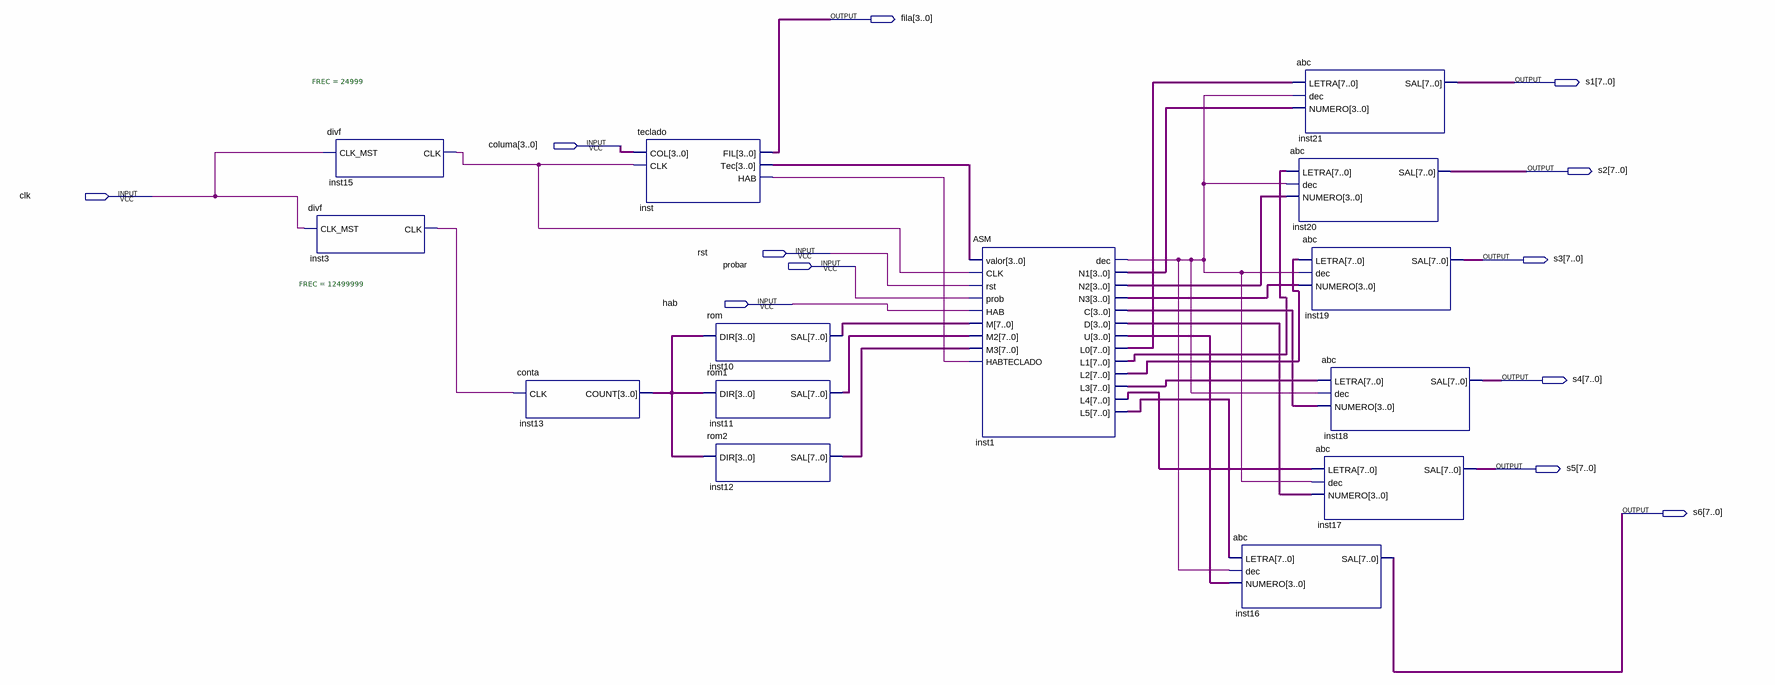
[diagram p0: schematic sheet]
// Quartus schematic numA.bdf as structural Verilog: 14 symbols, 12 pins
module numA (
  input  [3:0] columa,
  input  clk,
  input  rst,
  input  probar,
  input  hab,
  output [3:0] fila,
  output [7:0] s1,
  output [7:0] s2,
  output [7:0] s3,
  output [7:0] s4,
  output [7:0] s5,
  output [7:0] s6
);

  wire inst1_dec, inst3_clk, inst15_clk, inst_hab;
  wire [3:0] inst1_c, inst1_d, inst1_n1, inst1_n2, inst1_n3, inst1_u, inst13_count, inst_tec;
  wire [7:0] inst1_l0, inst1_l1, inst1_l2, inst1_l3, inst1_l4, inst1_l5, inst10_sal, inst11_sal, inst12_sal;

  divf #(.FREC(12499999)) inst3 (.CLK_MST(clk), .CLK(inst3_clk));
  divf #(.FREC(24999)) inst15 (.CLK_MST(clk), .CLK(inst15_clk));
  conta inst13 (.CLK(inst3_clk), .COUNT(inst13_count));
  teclado inst (.COL(columa), .CLK(inst15_clk), .FIL(fila), .Tec(inst_tec), .HAB(inst_hab));
  rom inst10 (.DIR(inst13_count), .SAL(inst10_sal));
  rom1 inst11 (.DIR(inst13_count), .SAL(inst11_sal));
  rom2 inst12 (.DIR(inst13_count), .SAL(inst12_sal));
  ASM inst1 (
    .valor(inst_tec), .CLK(inst15_clk), .rst(rst), .prob(probar), .HAB(hab), .M(inst10_sal), .M2(inst11_sal),
    .M3(inst12_sal), .HABTECLADO(inst_hab), .dec(inst1_dec), .N1(inst1_n1), .N2(inst1_n2), .N3(inst1_n3),
    .C(inst1_c), .D(inst1_d), .U(inst1_u), .L0(inst1_l0), .L1(inst1_l1), .L2(inst1_l2), .L3(inst1_l3),
    .L4(inst1_l4), .L5(inst1_l5));
  abc inst16 (.LETRA(inst1_l5), .dec(inst1_dec), .NUMERO(inst1_u), .SAL(s6));
  abc inst21 (.LETRA(inst1_l0), .dec(inst1_dec), .NUMERO(inst1_n1), .SAL(s1));
  abc inst20 (.LETRA(inst1_l1), .dec(inst1_dec), .NUMERO(inst1_n2), .SAL(s2));
  abc inst19 (.LETRA(inst1_l2), .dec(inst1_dec), .NUMERO(inst1_n3), .SAL(s3));
  abc inst18 (.LETRA(inst1_l3), .dec(inst1_dec), .NUMERO(inst1_c), .SAL(s4));
  abc inst17 (.LETRA(inst1_l4), .dec(inst1_dec), .NUMERO(inst1_d), .SAL(s5));
endmodule
